# Altium schematic sheet [06] - BOOT CONTROL.SchDoc
size A2; DocumentNumber: 2; SheetNumber: 6; SheetTotal: 10
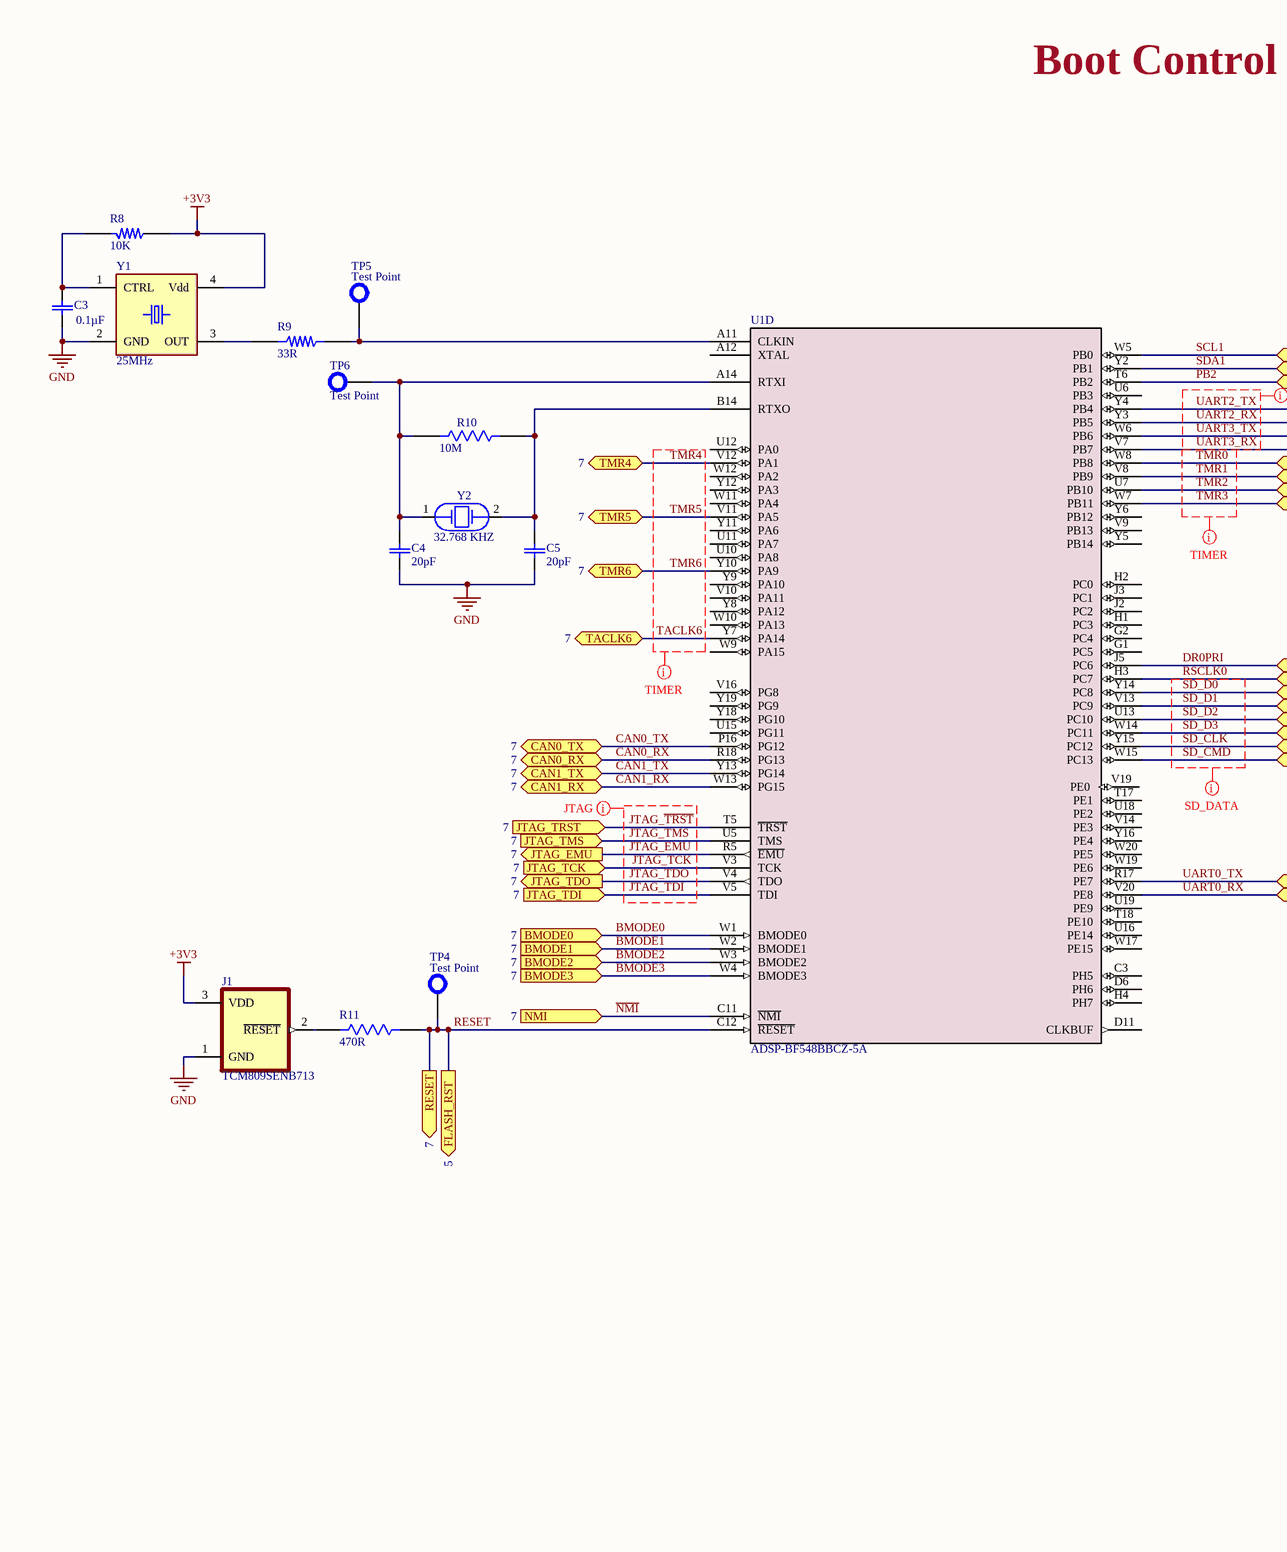
[diagram p0: [06] - BOOT CONTROL.SchDoc, left]
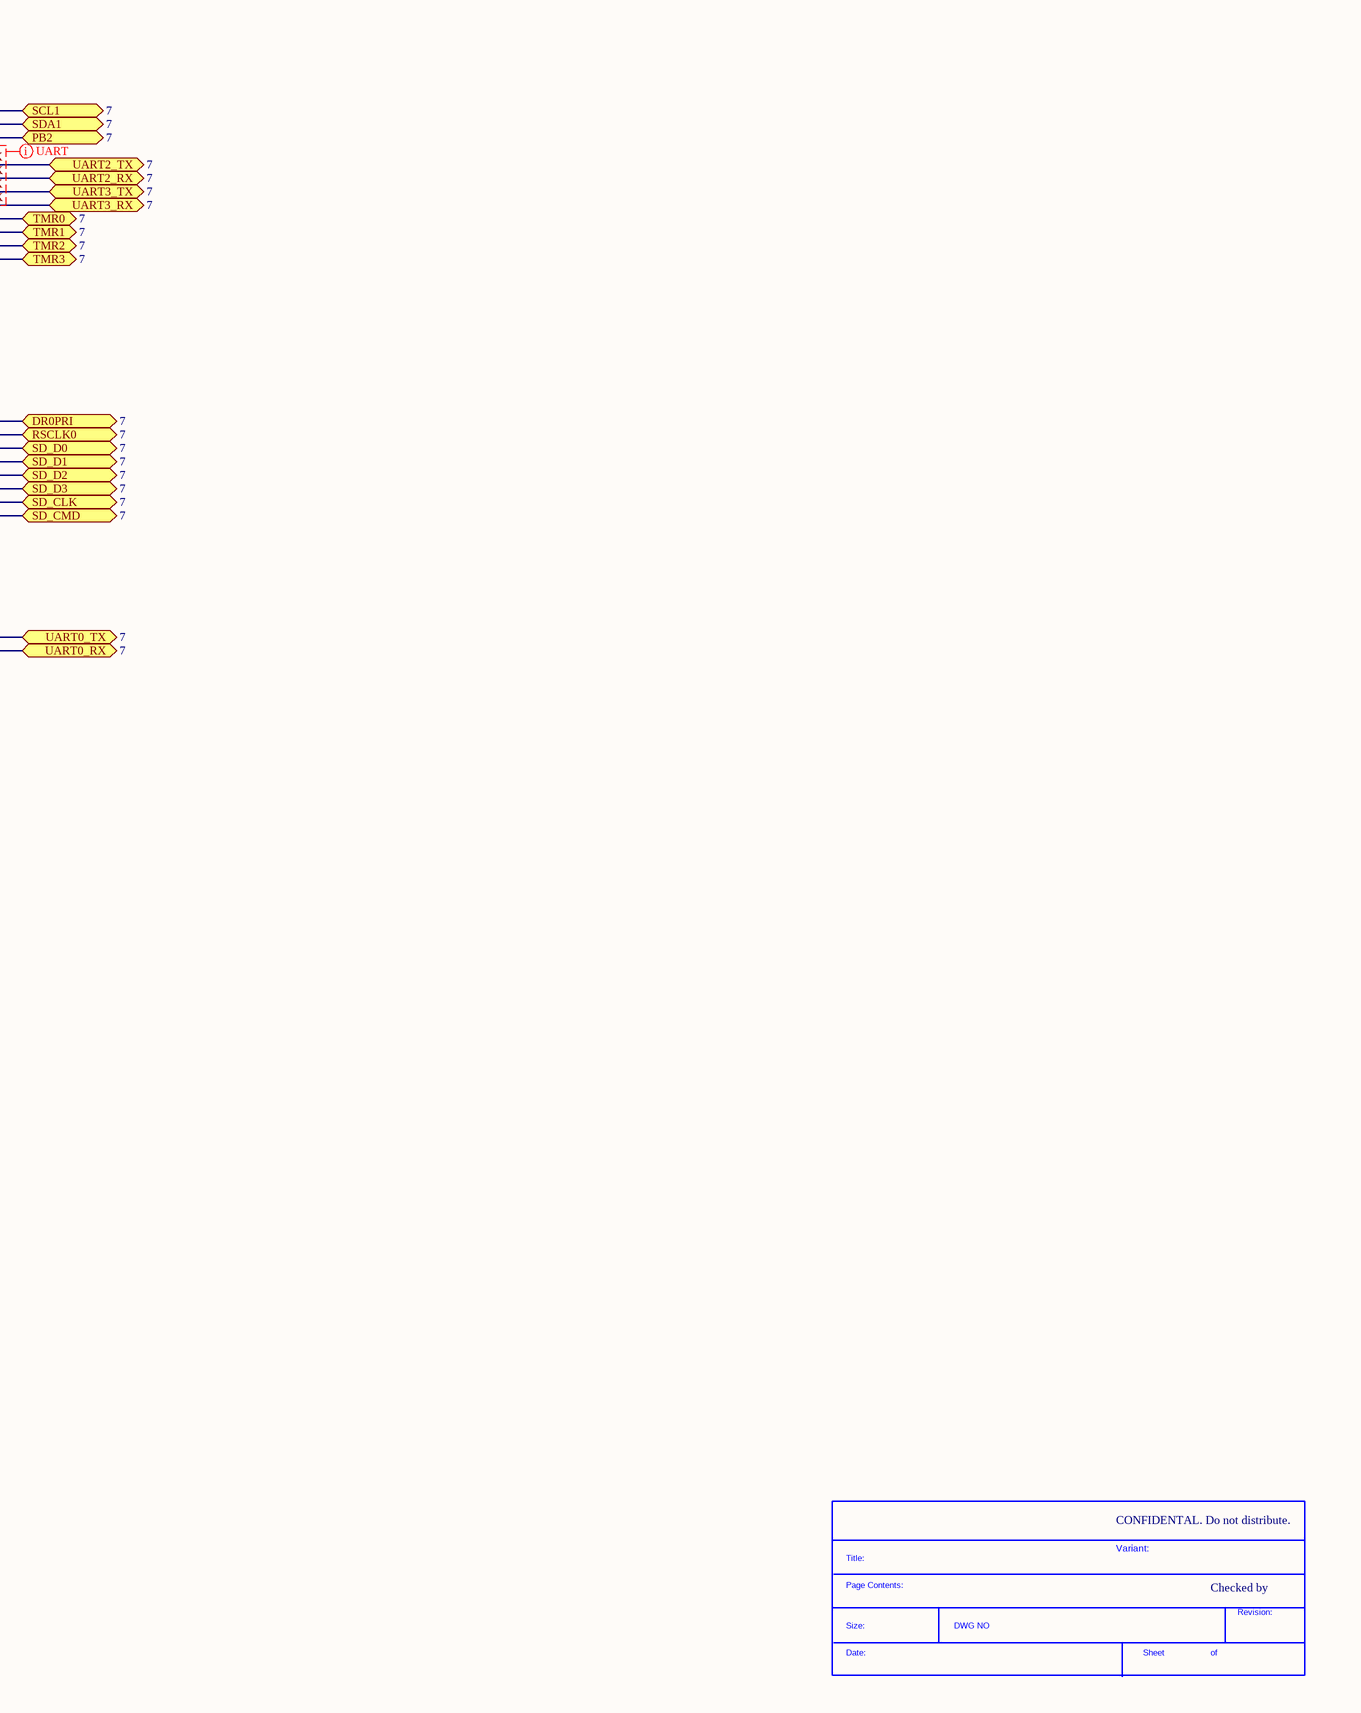
[diagram p1: [06] - BOOT CONTROL.SchDoc, right]

## Parts
*  SDTitleBlock  (value not drawn)  (graphical)
C3  0.1µF  [CAP0402]
C4  20pF  [CAPC10555_55N_KEM-L]
C5  20pF  [CAPC10555_55N_KEM-L]
J1  TCM809SENB713  [SOT-23B]
R8  10K  [RES0402]
R9  33R  [RES0402]
R10  10M  [RES0603]
R11  470R  [RES0402]
TP4  Test Point  [TP_70MIL]
TP5  Test Point  [TP_70MIL]
TP6  Test Point  [TP_70MIL]
U1  ADSP-BF548BBCZ-5A  [BC_400_1_ADI]  (part D of 7)
Y1  25MHz  [4-SMD]
Y2  32.768 KHZ  [XTAL_G83270022]

## Ports
BMODE0 (in, see 7), BMODE1 (in, see 7), BMODE2 (in, see 7), BMODE3 (in, see 7), CAN0_RX (bidir, see 7), CAN0_TX (bidir, see 7), CAN1_RX (bidir, see 7), CAN1_TX (bidir, see 7), DR0PRI (bidir, see 7), FLASH_RST (out, see 5), JTAG_EMU (out, see 7), JTAG_TCK (in, see 7), JTAG_TDI (in, see 7), JTAG_TDO (out, see 7), JTAG_TMS (in, see 7), JTAG_TRST (in, see 7), NMI (in, see 7), PB2 (bidir, see 7), RESET (out, see 7), RSCLK0 (bidir, see 7), SCL1 (bidir, see 7), SD_CLK (bidir, see 7), SD_CMD (bidir, see 7), SD_D0 (bidir, see 7), SD_D1 (bidir, see 7), SD_D2 (bidir, see 7), SD_D3 (bidir, see 7), SDA1 (bidir, see 7), TACLK6 (bidir, see 7), TMR0 (bidir, see 7), TMR1 (bidir, see 7), TMR2 (bidir, see 7), TMR3 (bidir, see 7), TMR4 (bidir, see 7), TMR5 (bidir, see 7), TMR6 (bidir, see 7), UART0_RX (bidir, see 7), UART0_TX (bidir, see 7), UART2_RX (bidir, see 7), UART2_TX (bidir, see 7), UART3_RX (bidir, see 7), UART3_TX (bidir, see 7)

## Nets
+3V3: J1.3(VDD) R8.1 Y1.4(Vdd)
GND: C3.1 C4.1 C5.1 J1.1(GND) Y1.2(GND)
BMODE0: U1.W1(BMODE0) ; port BMODE0
BMODE1: U1.W2(BMODE1) ; port BMODE1
BMODE2: U1.W3(BMODE2) ; port BMODE2
BMODE3: U1.W4(BMODE3) ; port BMODE3
CAN0_RX: U1.R18(PG13) ; port CAN0_RX
CAN0_TX: U1.P16(PG12) ; port CAN0_TX
CAN1_RX: U1.W13(PG15) ; port CAN1_RX
CAN1_TX: U1.Y13(PG14) ; port CAN1_TX
DR0PRI: U1.J5(PC6) ; port DR0PRI
JTAG_~{EMU}: U1.R5(~{EMU}) ; port JTAG_EMU
JTAG_~{TRST}: U1.T5(~{TRST}) ; port JTAG_TRST
JTAG_TCK: U1.V3(TCK) ; port JTAG_TCK
JTAG_TDI: U1.V5(TDI) ; port JTAG_TDI
JTAG_TDO: U1.V4(TDO) ; port JTAG_TDO
JTAG_TMS: U1.U5(TMS) ; port JTAG_TMS
~{NMI}: U1.C11(~{NMI}) ; port NMI
PB2: U1.T6(PB2) ; port PB2
RESET: R11.2 TP4.0 U1.C12(~{RESET}) ; port FLASH_RST, port RESET
RSCLK0: U1.H3(PC7) ; port RSCLK0
SCL1: U1.W5(PB0) ; port SCL1
SD_CLK: U1.Y15(PC12) ; port SD_CLK
SD_CMD: U1.W15(PC13) ; port SD_CMD
SD_D0: U1.Y14(PC8) ; port SD_D0
SD_D1: U1.V13(PC9) ; port SD_D1
SD_D2: U1.U13(PC10) ; port SD_D2
SD_D3: U1.W14(PC11) ; port SD_D3
SDA1: U1.Y2(PB1) ; port SDA1
TACLK6: U1.Y7(PA14) ; port TACLK6
TMR0: U1.W8(PB8) ; port TMR0
TMR1: U1.V8(PB9) ; port TMR1
TMR2: U1.U7(PB10) ; port TMR2
TMR3: U1.W7(PB11) ; port TMR3
TMR4: U1.V12(PA1) ; port TMR4
TMR5: U1.V11(PA5) ; port TMR5
TMR6: U1.Y10(PA9) ; port TMR6
UART0_RX: U1.V20(PE8) ; port UART0_RX
UART0_TX: U1.R17(PE7) ; port UART0_TX
UART2_RX: U1.Y3(PB5) ; port UART2_RX
UART2_TX: U1.Y4(PB4) ; port UART2_TX
UART3_RX: U1.V7(PB7) ; port UART3_RX
UART3_TX: U1.W6(PB6) ; port UART3_TX
NetC3_2: C3.2 R8.2 Y1.1(CTRL)
NetC4_2: C4.2 R10.1 TP6.0 U1.A14(RTXI) Y2.1
NetC5_2: C5.2 R10.2 U1.B14(RTXO) Y2.2
NetJ1_2: J1.2(~{RESET}) R11.1
NetR9_1: R9.1 Y1.3(OUT)
NetR9_2: R9.2 TP5.0 U1.A11(CLKIN)

Not connected (* = marked no-connect by the designer): U1 A12(XTAL) C3(PH5) D6(PH6) D11(CLKBUF) G1(PC5) G2(PC4) H1(PC3) H2(PC0) H4(PH7) J2(PC2) J3(PC1) T17(PE1) T18(PE10) U6(PB3) U10(PA8) U11(PA7) U12(PA0) U15(PG11) U16(PE14) U18(PE2) U19(PE9) V9(PB13) V10(PA11) V14(PE3) V16(PG8) V19(PE0) W9(PA15) W10(PA13) W11(PA4) W12(PA2) W17(PE15) W19(PE6) W20(PE5) Y5(PB14) Y6(PB12) Y8(PA12) Y9(PA10) Y11(PA6) Y12(PA3) Y16(PE4) Y18(PG10) Y19(PG9)

## Layout directives
net class SD_DATA: RSCLK0, SD_CLK, SD_CMD, SD_D0, SD_D1, SD_D2, SD_D3
net class TIMER: TACLK6, TMR0, TMR1, TMR2, TMR3, TMR4, TMR5, TMR6, UART3_RX
net class UART: UART2_RX, UART2_TX, UART3_RX, UART3_TX
net class JTAG: JTAG_TCK, JTAG_TDI, JTAG_TDO, JTAG_TMS, JTAG_~{EMU}, JTAG_~{TRST}

## Notes on the sheet
- Boot Control
- CLOCKS (CPU & PCIE)
- CONFIDENTAL. Do not distribute.
- Variant:
- Checked by
- (in symbol SDTitleBlock) Title:; Page Contents:; Revision:; Size:; DWG NO; Date:; Sheet; of

## Library data of the parts
C3 = CL05B104KO5NNNC: 0.1µF ±10% 16V Ceramic Capacitor X7R 0402 (1005 Metric); Manufacturer: Samsung Electro-Mechanics; Digi-Key Part Number: 1276-1001-2-ND; Manufacturer Product Number: CL05B104KO5NNNC; Capacitance: 0.1µF; Package / Case: 0402 (1005 Metric)
C4 C5 = C0402C200J3GAC7867: 20pF ±5% 25V Ceramic Capacitor C0G, NP0 0402 (1005 Metric); Vendor: Kemet; Manufacturer Part Number: C0402C200J3GAC7867; Tolerance: ±5%; Voltage - Rated: 25V; Temperature Coefficient: C0G, NP0; Operating Temperature: -55°C ~ 125°C; Package: 0402; Capacitance: 20pF
J1 = TCM809SENB713: Supervisor Push-Pull, Totem Pole 1 Channel SOT-23-3; Manufacturer: Microchip Technology; Digi-Key Part Number: TCM809SENB713TR-ND; Manufacturer Product Number: TCM809SENB713; Package / Case: TO-236-3, SC-59, SOT-23-3
R8 = RE0402FRE0710KL: 10 kOhms ±1% 0.063W, 1/16W Chip Resistor 0402 (1005 Metric) Moisture Resistant Thick Film; Manufacturer: Yageo; Digi-Key Part Number: 13-RE0402FRE0710KLTR-ND; Manufacturer Product Number: RE0402FRE0710KL; Supplier: Yageo; Package / Case: 0402 (1005 Metric)
R9 = CRCW040233R0JNEE: 33 Ohms ±5% 0.063W, 1/16W Chip Resistor 0402 (1005 Metric) Automotive AEC-Q200 Thick Film; Manufacturer: Vishay Dale; Digi-Key Part Number: CRCW040233R0JNEE-ND; Manufacturer Product Number: CRCW040233R0JNEE; Supplier: Vishay Dale; Package / Case: 0402; Resistance: 33R
R10 = CRCW060310M0FHEAP: 10 MOhms ±1% 0.1W, 1/10W Chip Resistor 0603 (1608 Metric) Automotive AEC-Q200 Thick Film; Manufacturer: Vishay Dale; Digi-Key Part Number: CRCW060310M0FHEAP-ND; Manufacturer Product Number: CRCW060310M0FHEAP; Package / Case: 0603; Resistance: 10 MOhms
R11 = CRGCQ0402F470K: 470 kOhms ±1% 0.063W, 1/16W Chip Resistor 0402 (1005 Metric) Automotive AEC-Q200, Moisture Resistant Thick Film; Manufacturer: TE Connectivity Passive Product; Digi-Key Part Number: A129659TR-ND; Manufacturer Product Number: CRGCQ0402F470K; Supplier: TE Connectivity Passive Product; Package / Case: 0402 (1005 Metric)
TP4-TP6 = TP
U1 = ADSP-BF548BBCZ-5A: IC DSP 16BIT 533MHZ 400CSBGA; Manufacturer: Analog Devices Inc.; Manufacturer_Part_Number: ADSP-BF548BBCZ-5A; Supplier: Analog Devices Inc.; Manufacturer Product Number: ADSP-BF548BBCZ-5A; TypeDigi-Key Part Number: ADSP-BF548BBCZ-5A-ND
Y1 = CPPT7L-BR-25.0TS: 25MHz XO (Standard) TTL Oscillator 3.3V Enable/Disable 4-SMD, No Lead; Manufacturer: Cardinal Components Inc.; Digi-Key Part Number: CPPT7L-BR-25.0TS-ND; Manufacturer Product Number: CPPT7L-BR-25.0TS; Supplier: Cardinal Components Inc.; Frequency: 25MHz; Package / Case: 4-SMD, No Lead
Y2 = G83270022: 32.768kHz ±10ppm Crystal 12.5pF 70 kOhms 2-SMD, No Lead; MF: Diodes Inc.; Value: 32.768kHz; Package: 2-SMD, No Lead; Load Capacitance: 12.5pF; Manufacturer Product Number: G83270022; Frequency Tolerance: ±10ppm